# Altium schematic sheet Sheet2.SchDoc: LM61460 Main Rail
size A3; DrawnBy: Jayant Yadav; SheetNumber: 2; SheetTotal: 4
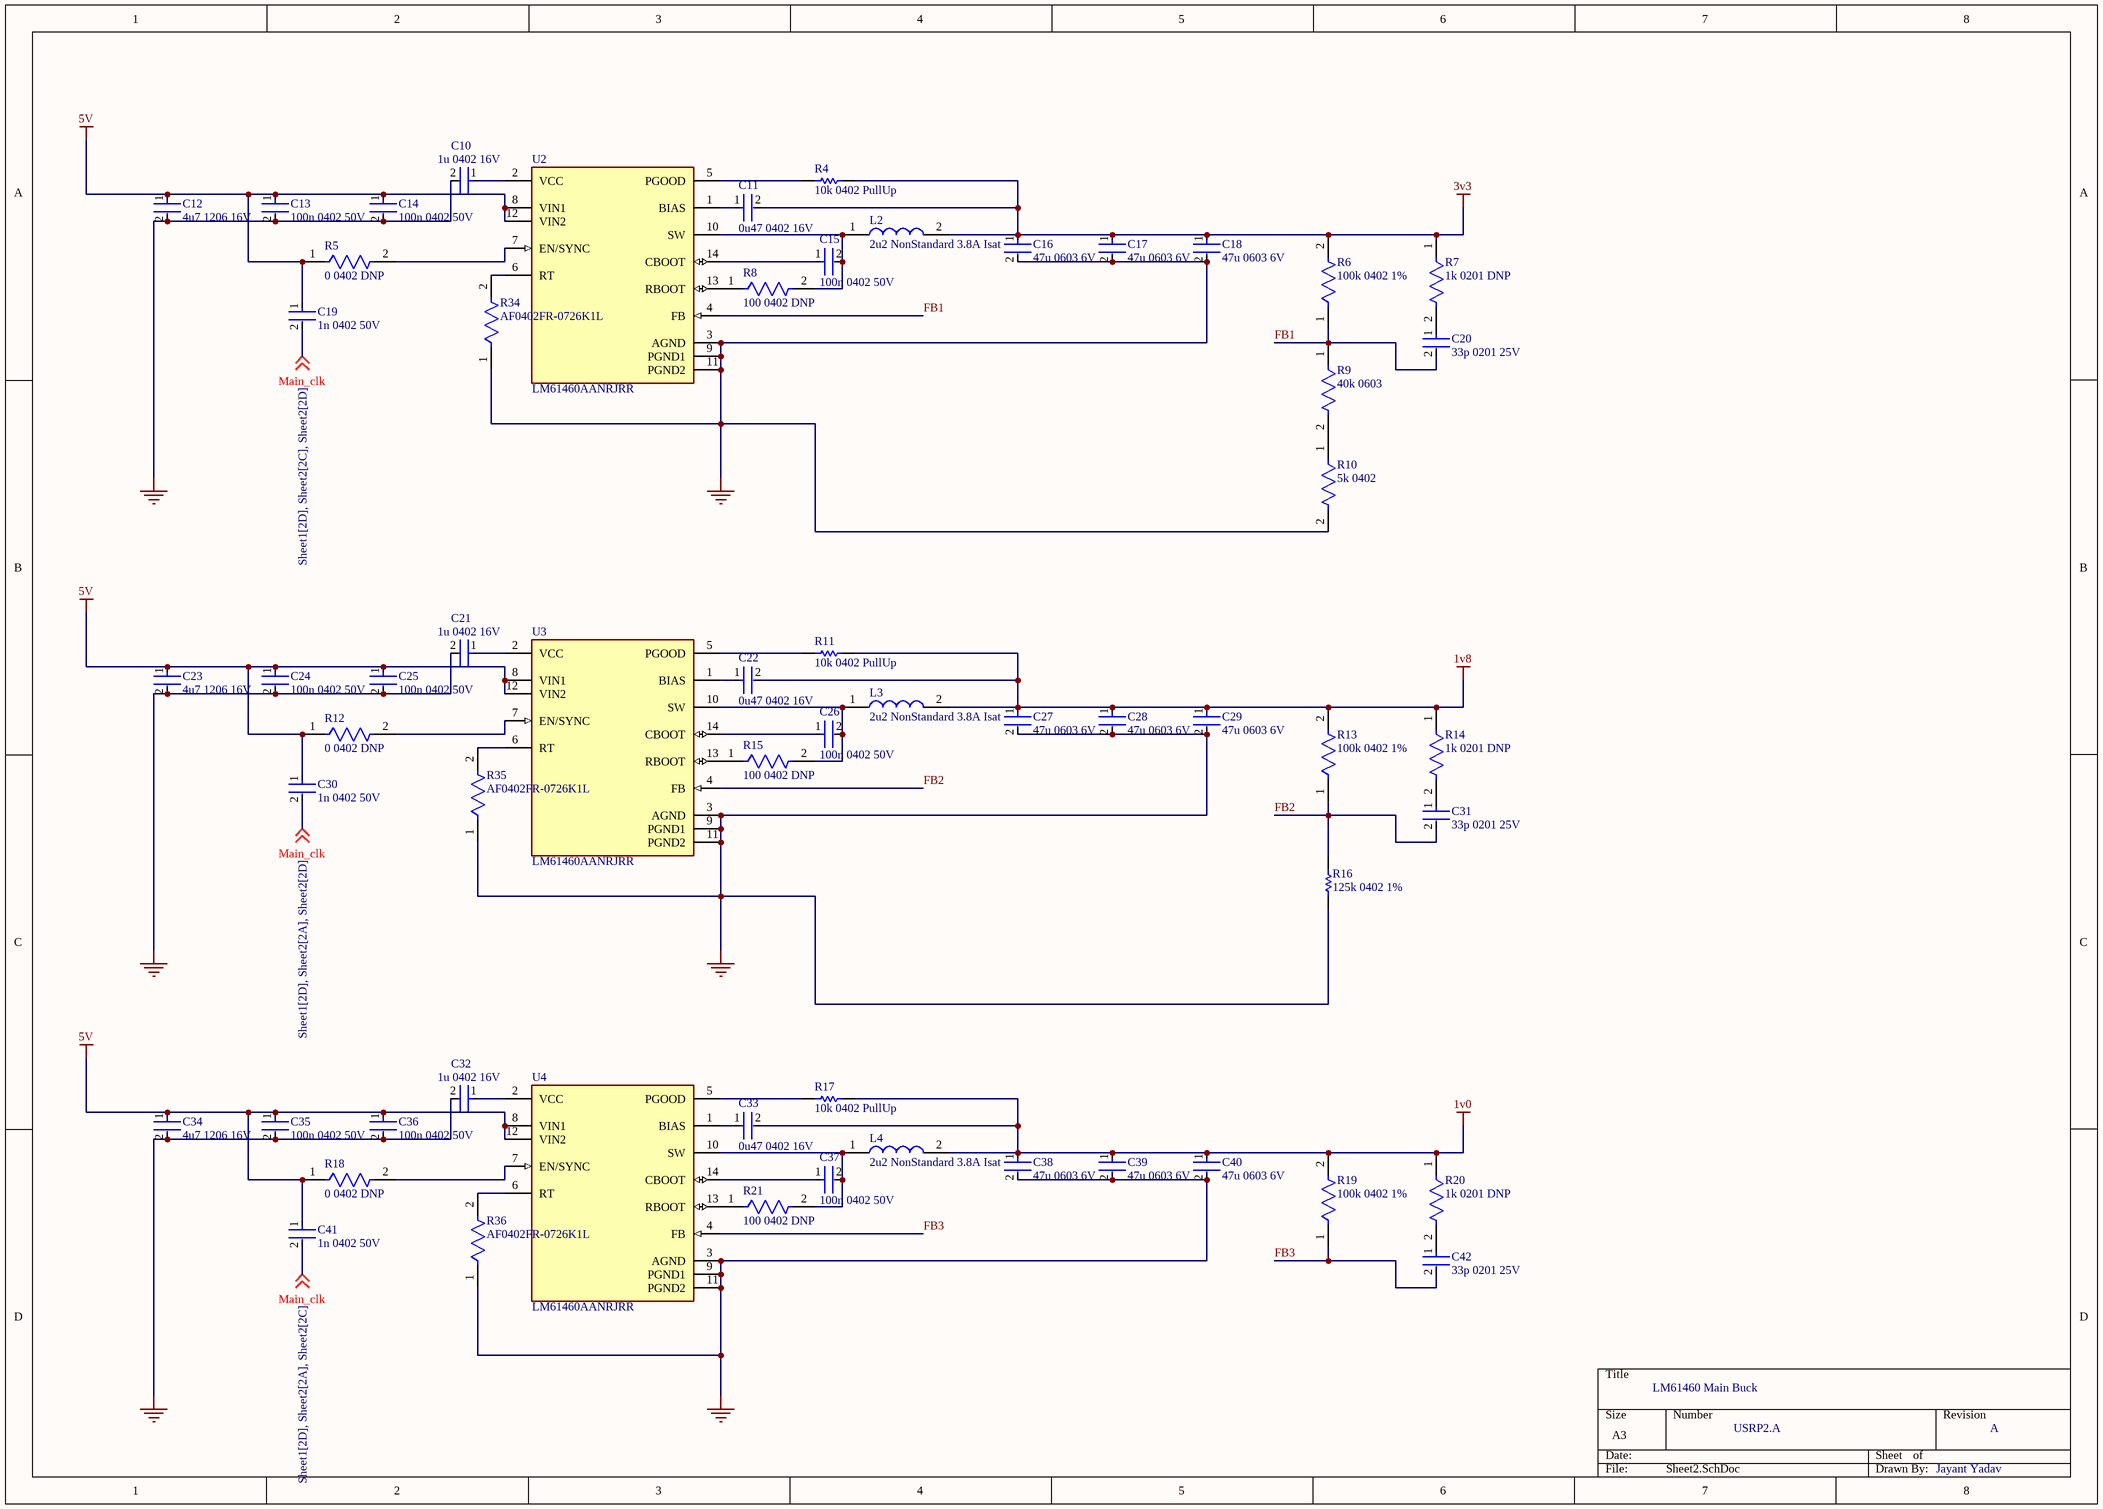
[diagram p0: Sheet2.SchDoc]

## Parts
C10  1u 0402 16V  [FP-CC0402-MFG]
C11  0u47 0402 16V  [FP-CC0402-CB-MFG]
C12  4u7 1206 16V  [FP-C3216-160-0_2-IPC_B]
C13  100n 0402 50V  [FP-0402B104K500CT-IPC_C]
C14  100n 0402 50V  [FP-0402B104K500CT-IPC_C]
C15  100n 0402 50V  [FP-0402B104K500CT-IPC_C]
C16  47u 0603 6V  [FP-GRM188-0_2-IPC_B]
C17  47u 0603 6V  [FP-GRM188-0_2-IPC_B]
C18  47u 0603 6V  [FP-GRM188-0_2-IPC_B]
C19  1n 0402 50V  [FP-0402B104K500CT-IPC_C]
C20  33p 0201 25V  [FP-C0201-AB-MFG]
C21  1u 0402 16V  [FP-CC0402-MFG]
C22  0u47 0402 16V  [FP-CC0402-CB-MFG]
C23  4u7 1206 16V  [FP-C3216-160-0_2-IPC_B]
C24  100n 0402 50V  [FP-0402B104K500CT-IPC_C]
C25  100n 0402 50V  [FP-0402B104K500CT-IPC_C]
C26  100n 0402 50V  [FP-0402B104K500CT-IPC_C]
C27  47u 0603 6V  [FP-GRM188-0_2-IPC_B]
C28  47u 0603 6V  [FP-GRM188-0_2-IPC_B]
C29  47u 0603 6V  [FP-GRM188-0_2-IPC_B]
C30  1n 0402 50V  [FP-0402B104K500CT-IPC_C]
C31  33p 0201 25V  [FP-C0201-AB-MFG]
C32  1u 0402 16V  [FP-CC0402-MFG]
C33  0u47 0402 16V  [FP-CC0402-CB-MFG]
C34  4u7 1206 16V  [FP-C3216-160-0_2-IPC_B]
C35  100n 0402 50V  [FP-0402B104K500CT-IPC_C]
C36  100n 0402 50V  [FP-0402B104K500CT-IPC_C]
C37  100n 0402 50V  [FP-0402B104K500CT-IPC_C]
C38  47u 0603 6V  [FP-GRM188-0_2-IPC_B]
C39  47u 0603 6V  [FP-GRM188-0_2-IPC_B]
C40  47u 0603 6V  [FP-GRM188-0_2-IPC_B]
C41  1n 0402 50V  [FP-0402B104K500CT-IPC_C]
C42  33p 0201 25V  [FP-C0201-AB-MFG]
L2  2u2 NonStandard 3.8A Isat  [SRP4020FA2R2M]
L3  2u2 NonStandard 3.8A Isat  [SRP4020FA2R2M]
L4  2u2 NonStandard 3.8A Isat  [SRP4020FA2R2M]
R4  10k 0402 PullUp  [RESC1005X40X20NL05T10]
R5  0 0402 DNP  [FP-CRCW0402-e3-IPC_C]
R6  100k 0402 1%  [FP-CRGCQ0402-IPC_C]
R7  1k 0201 DNP  [FP-AF0201-IPC_B]
R8  100 0402 DNP  [FP-AC0402-MFG]
R9  40k 0603  [FP-AT0603-IPC_B]
R10  5k 0402  [FP-PNM0402-IPC_C]
R11  10k 0402 PullUp  [RESC1005X40X20NL05T10]
R12  0 0402 DNP  [FP-CRCW0402-e3-IPC_C]
R13  100k 0402 1%  [FP-CRGCQ0402-IPC_C]
R14  1k 0201 DNP  [FP-AF0201-IPC_B]
R15  100 0402 DNP  [FP-AC0402-MFG]
R16  125k 0402 1%  [RESC1005X40X25NL10T10]
R17  10k 0402 PullUp  [RESC1005X40X20NL05T10]
R18  0 0402 DNP  [FP-CRCW0402-e3-IPC_C]
R19  100k 0402 1%  [FP-CRGCQ0402-IPC_C]
R20  1k 0201 DNP  [FP-AF0201-IPC_B]
R21  100 0402 DNP  [FP-AC0402-MFG]
R34  AF0402FR-0726K1L  [FP-AF0402-MFG]
R35  AF0402FR-0726K1L  [FP-AF0402-MFG]
R36  AF0402FR-0726K1L  [FP-AF0402-MFG]
U2  LM61460AANRJRR  [FP-RJR0014A-MFG]
U3  LM61460AANRJRR  [FP-RJR0014A-MFG]
U4  LM61460AANRJRR  [FP-RJR0014A-MFG]

## Nets
1v0: C33.2 C38.1 C39.1 C40.1 L4.2 R17.2 R19.2 R20.1
1v8: C22.2 C27.1 C28.1 C29.1 L3.2 R11.2 R13.2 R14.1
3v3: C11.2 C16.1 C17.1 C18.1 L2.2 R4.2 R6.2 R7.1
5V: C12.1 C13.1 C14.1 C19.1 C23.1 C24.1 C25.1 C30.1 C34.1 C35.1 C36.1 C41.1 R5.1 R12.1 R18.1 U2.8(VIN1) U2.12(VIN2) U3.8(VIN1) U3.12(VIN2) U4.8(VIN1) U4.12(VIN2)
GND: C10.2 C12.2 C13.2 C14.2 C16.2 C17.2 C18.2 C21.2 C23.2 C24.2 C25.2 C27.2 C28.2 C29.2 C32.2 C34.2 C35.2 C36.2 C38.2 C39.2 C40.2 R10.2 R16.1 R34.1 R35.1 R36.1 U2.3(AGND) U2.9(PGND1) U2.11(PGND2) U3.3(AGND) U3.9(PGND1) U3.11(PGND2) U4.3(AGND) U4.9(PGND1) U4.11(PGND2)
FB1: C20.2 R6.1 R9.1 U2.4(FB)
FB2: C31.2 R13.1 R16.2 U3.4(FB)
FB3: C42.2 R19.1 U4.4(FB)
Main_clk: C19.2 C30.2 C41.2 ; off-sheet Main_clk
NetC10_1: C10.1 U2.2(VCC)
NetC11_1: C11.1 U2.1(BIAS)
NetC15_1: C15.1 U2.14(CBOOT)
NetC15_2: C15.2 L2.1 R8.2 U2.10(SW)
NetC20_1: C20.1 R7.2
NetC21_1: C21.1 U3.2(VCC)
NetC22_1: C22.1 U3.1(BIAS)
NetC26_1: C26.1 U3.14(CBOOT)
NetC26_2: C26.2 L3.1 R15.2 U3.10(SW)
NetC31_1: C31.1 R14.2
NetC32_1: C32.1 U4.2(VCC)
NetC33_1: C33.1 U4.1(BIAS)
NetC37_1: C37.1 U4.14(CBOOT)
NetC37_2: C37.2 L4.1 R21.2 U4.10(SW)
NetC42_1: C42.1 R20.2
NetR4_1: R4.1 U2.5(PGOOD)
NetR5_2: R5.2 U2.7(EN/SYNC)
NetR8_1: R8.1 U2.13(RBOOT)
NetR9_2: R9.2 R10.1
NetR11_1: R11.1 U3.5(PGOOD)
NetR12_2: R12.2 U3.7(EN/SYNC)
NetR15_1: R15.1 U3.13(RBOOT)
NetR17_1: R17.1 U4.5(PGOOD)
NetR18_2: R18.2 U4.7(EN/SYNC)
NetR21_1: R21.1 U4.13(RBOOT)
NetR34_2: R34.2 U2.6(RT)
NetR35_2: R35.2 U3.6(RT)
NetR36_2: R36.2 U4.6(RT)

## Notes on the sheet
- LM61460 Main Buck
- USRP2.A
- A
- Jayant Yadav

## Library data of the parts
C10 C21 C32 = CMP-03422-001191-1: CAP CER 1UF 16V X5R 0402; Manufacturer: YAGEO; Manufacturer Part Number: CC0402KRX5R7BB105; Automotive Grade: NA; Material: Ceramic; Tolerance: 0.1; Temperature Coefficient: 30ppm/°C; Octopart: https://octopart.com/cc0402krx5r7bb105-yageo-25629500; Digikey Description: CAP CER 1UF 16V X5R 0402; ComponentLink2URL: http://www.yageo.com/documents/recent/UPY-GP_NP0_16V-to-50V_16.pdf; Lead Free: Yes; Ipc Land Pattern Name: CAPC10050X50; Device Class L3: Ceramic Capacitors; Capacitance: 1 uF; Automotive: No; Device Class L2: Capacitors; Package: CC0402; Footprint Url: http://www.yageo.com/exep/pages/download/literatures/UPY-C_GEN_24.pdf; Temperature Range Low: -55°C; Value: 1 uF; Temperature Range High: +125°C; Height: 0.55mm; Category: Cap; ComponentLink2Description: Datasheet; Temperature Characteristic: X5R; Voltage Rating: 16 V; Mouser Description: 0402 1 uF 16 V ±10% Tolerance X5R Multilayer Ceramic Chip Capacitor; Temperature: -55°C to +125°C; Device Class L1: Passive Components; RoHS: TRUE
C11 C22 C33 = CMP-03422-000370-2: CAP CER 0.47UF 16V X5R 0402; Tolerance: 10%; Capacitance: 470nF; Halogen Free: Halogen Free; Case/Package: 0402; Mount: Surface Mount; Lead Free: Lead Free; Packaging: Tape and Reel; Width: 0.02inch; Voltage Rating (DC): 16V; Thickness: 0.022inch; Max Operating Temperature: 85°C; Length: 0.039inch; Voltage Rating: 16V; Min Operating Temperature: -55°C; RoHS Compliant: Yes
C12 C23 C34 = CMP-08246-006479-1: Multilayer Ceramic Capacitors 4.7uF ±20% 16V X7R SMD 1206; Voltage Rating (DC): 16V; Weight: 0.000571oz; RoHS Compliant: Yes; Case Code (Imperial): 1206; Series: C; Mount: Surface Mount; Case/Package: 1206; Height: 1.6mm; Case Code (Metric): 3216; Voltage Rating: 16V; Number of Pins: 2; Termination: SMD/SMT; Resistor Type: Ceramic; Capacitance: 4.7uF; Length: 0.126inch; Max Operating Temperature: 125°C; Packaging: Tape and Reel; Tolerance: 20%; Dielectric: X7R; Thickness: 0.071inch; Width: 0.063inch; Package Quantity: 1; Min Operating Temperature: -55°C; Features: Soft Termination; Depth: 1.6mm
C13-C15 C19 C24-C26 C30 C35-C37 C41 = CMP-45632-000010-1: CAP CER 0.1UF 50V X7R 0402; Tolerance: 10%; Capacitance: 100nF; Max Operating Temperature: 125°C; Case Code (Metric): 1005; RoHS Compliant: Yes; Series: -; Case Code (Imperial): 0402; Voltage Rating: 50V; Min Operating Temperature: -55°C; Mount: Surface Mount; Case/Package: 0402; Packaging: Cut Tape
C16-C18 C27-C29 C38-C40 = CMP-2000-05444-2: Chip Multilayer Ceramic Capacitors for General Purpose, 0603, 47uF, X5R, 15%, 20%, 6.3V; Voltage Rating (DC): 6.3V; Thickness: 0.039inch; Case Code (Imperial): 0603; Packaging: Tape and Reel; Capacitance: 47uF; Width: 0.031inch; Dielectric: X5R; Max Operating Temperature: 85°C; Mount: Surface Mount; Case Code (Metric): 1608; Length: 0.063inch; Voltage Rating: 6.3V; Tolerance: 20%; Case/Package: 0603; Min Operating Temperature: -55°C
C20 C31 C42 = CMP-03020-011228-1: CAP CER 33PF 25V 5% NP0 0201; Manufacturer: KEMET; Manufacturer Part Number: C0201C330J3GACTU; Temperature Characteristic: C0G; Standoff Height: 0mm; Material: Ceramic; Temperature Coefficient: 30ppm/°C; Tolerance: 0.05; Voltage Rating: 25 V; Temperature Range Low: -55°C; Ipc Land Pattern Name: CAPC6030X30; Capacitance: 33 pF; ComponentLink2URL: https://content.kemet.com/datasheets/KEM_C1003_C0G_SMD.pdf; Automotive: No; Package: C0201-AB; Temperature: -55°C to +125°C; Height: 0.33mm; Digikey Description: CAP CER 33PF 25V 5% NP0 0201; Device Class L3: Ceramic Capacitors; Device Class L1: Passive Components; Device Class L2: Capacitors; Octopart: https://octopart.com/c0201c330j3gactu-kemet-16237019; Temperature Range High: +125°C; RoHS: TRUE; Category: Cap; Lead Free: Yes; ComponentLink2Description: Datasheet; Value: 33 pF; Mouser Description: Multilayer Ceramic Capacitors MLCC - SMD/SMT 25volts 33pF C0G 5%
L2-L4 = SRP4020FA-2R2M: Inductor; Manufacturer_Name: Bourns; Datasheet Link: https://www.bourns.com/docs/Product-Datasheets/SRP4020FA.pdf; Height: 2.1mm; Manufacturer_Part_Number: SRP4020FA-2R2M; Mouser Part Number: 652-SRP4020FA-2R2M; Mouser Price/Stock: https://www.mouser.co.uk/ProductDetail/Bourns/SRP4020FA-2R2M?qs=MLItCLRbWswKB3debRJXpA%3D%3D; Arrow Part Number: SRP4020FA-2R2M; Arrow Price/Stock: https://www.arrow.com/en/products/srp4020fa-2r2m/bourns.html?utm_currency=USD&region=nac
R4 R11 R17 = CMP-2002-01682-1: Manufacturer: Vishay BCcomponents; Part Number: TNPW040210K0DEED
R5 R12 R18 = CMP-2002-08122-2: RES Thick Film, 0Ω, 0.063W, 0402; Tolerance: 5%; Max Power Dissipation: 63mW; Voltage Rating: 50V; Temperature Coefficient: 100ppm/°C; Resistance: 0mR; Contact Plating: Tin; Height: 0.35mm; Radiation Hardening: No; Features: Automotive AEC-Q200; Composition: Thick Film; Width: 0.5mm; Weight: 2.3E-05oz; Termination: SMD/SMT; Packaging: Tape and Reel; Mount: Surface Mount; Case Code (Metric): 1005; Military Standard: Not; Min Operating Temperature: -55°C; Number of Terminations: 2; Package Quantity: 1; Case Code (Imperial): 0402; Depth: 0.5mm; Max Operating Temperature: 155°C; Case/Package: 0402; Power Rating: 63mW; Lead Free: Lead Free; Voltage Rating (DC): 50V; Length: 1mm
R6 R13 R19 = CMP-03211-001412-1: CRGCQ0402 100KΩ 1% ±100ppm/°C 50V; Manufacturer Part Number: CRGCQ0402F100K; Manufacturer: TE Connectivity; Tolerance: 0.01; Power Rating: 0.0625W; Resistance: 100KΩ; Ambient Temperature Range High: +70°C; Series: CRGCQ; Temperature: -55°C to +155°C; Temperature Range Low: -55°C; ComponentLink2Description: Datasheet; Category: Res; Temperature Range High: +155°C; Automotive: Yes; Device Class L2: Resistors; Height: 0.4mm; Ipc Land Pattern Name: RESC10050X35; Voltage Rating: 50V; ComponentLink2URL: https://www.te.com/commerce/DocumentDelivery/DDEController?Action=showdoc&DocId=Data+Sheet%7F1773204-3%7F1%7Fpdf%7FEnglish%7FENG_DS_1773204-3_1.pdf%7F4-2176347-1150; Composition: Thick Film; Device Class L1: Passive Components; Device Class L3: Chip SMD Resistors; RoHS: TRUE; Temperature Coefficient: ±100ppm/°C; Lead Free: Yes; Value: 100KΩ; Octopart: https://octopart.com/crgcq0402f100k-te+connectivity-91017930; Package: CRGCQ0402
R7 R14 R20 = CMP-03412-042796-1: Anti-Sulfurated Chip Resistors Automotive Grade 1kΩ 1% 200ppm/°C 0201; Max Power Dissipation: 50mW; Resistance: 1kR; Case/Package: 0201; Length: 0.024inch; Tolerance: 1%; Width: 0.012inch; Height: 0.01inch; RoHS Compliant: Yes; Temperature Coefficient: 200ppm/°C; Max Operating Temperature: 125°C; Features: Moisture Resistant; Packaging: Tape and Reel; Resistor Type: Thick Film; Number of Terminations: 2; Min Operating Temperature: -55°C; Series: AF
R8 R15 R21 = CMP-03412-022855-2: RES 100Ω ±1% 0.063W 0402; Resistance: 100R; RoHS Compliant: Yes; Tolerance: 1%; Case/Package: 0402
R9 = CMP-03412-038922-1: Thin Film Chip Resistors Automotive Grade 40kΩ 0.1% 25ppm/°C 0603
R10 = CMP-02407-012302-1: RES SMD 5K OHM 0.1% 1/20W 0402; Temperature Coefficient: 25ppm/°C; Resistance: 5kR; Max Power Dissipation: 50mW; Width: 0.022inch; Height: 0.033inch; Tolerance: 0.1%; Number of Terminations: 2; Packaging: Tape and Reel; RoHS Compliant: Yes; Case Code (Imperial): 0402; Min Operating Temperature: -55°C; Case Code (Metric): 1005; Features: Moisture Resistant; Max Operating Temperature: 155°C; Package Quantity: 1000; Resistor Type: Thin Film; Length: 0.042inch; Case/Package: 0402
R16 = CMP-2002-06075-1: Manufacturer: Multicomp; Part Number: MC00625W0402125K5
R34-R36 = CMP-03412-040628-1: Anti-Sulfurated Chip Resistors Automotive Grade 26.1kΩ 1% 100ppm/°C 0402; Max Power Dissipation: 63mW; Resistance: 26.1kR; RoHS Compliant: Yes; Number of Terminations: 2; Width: 0.02inch; Temperature Coefficient: 100ppm/°C; Case/Package: 0402; Packaging: Tape and Reel; Height: 0.015inch; Length: 0.039inch; Max Operating Temperature: 155°C; Series: AF; Resistor Type: Thick Film; Features: Moisture Resistant; Min Operating Temperature: -55°C; Tolerance: 1%
U2-U4 = CMP-04918-000597-1: LM61460AAN PRODUCTION MATERIAL